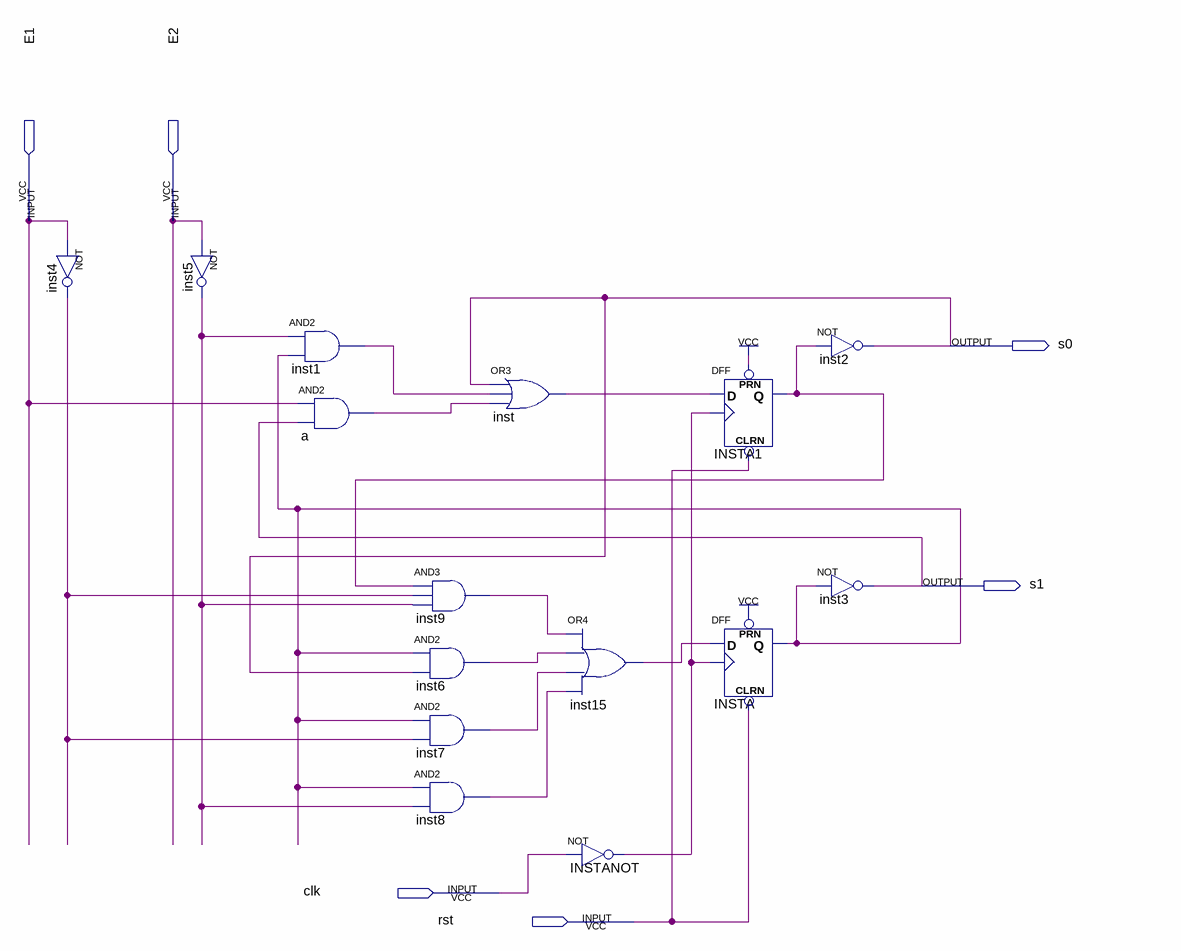
[diagram p0: schematic sheet]
// Quartus schematic P2 (1).bdf as structural Verilog: 15 symbols, 6 pins
module \P2_(1)  (
  input  E1,
  input  E2,
  input  clk,
  input  rst,
  output s0,
  output s1
);

  wire a_out, inst1_out, inst4_out, inst5_out, inst6_out, inst7_out, inst8_out, inst9_out, inst15_out,
       inst_out, INSTA1_q, INSTA_q, INSTANOT_out;

  not inst4 (inst4_out, E1);
  not inst5 (inst5_out, E2);
  and inst1 (inst1_out, inst5_out, INSTA_q);
  and a (a_out, E1, s1);
  and inst9 (inst9_out, INSTA1_q, inst4_out, inst5_out);
  and inst6 (inst6_out, INSTA_q, s0);
  and inst7 (inst7_out, INSTA_q, inst4_out);
  and inst8 (inst8_out, INSTA_q, inst5_out);
  or inst (inst_out, s0, inst1_out, a_out);
  or inst15 (inst15_out, inst9_out, inst6_out, inst7_out, inst8_out);
  not INSTANOT (INSTANOT_out, clk);
  DFF INSTA1 (.CLRN(rst), .CLK(INSTANOT_out), .D(inst_out), .PRN(1'b1), .Q(INSTA1_q));
  DFF INSTA (.CLRN(rst), .CLK(INSTANOT_out), .D(inst15_out), .PRN(1'b1), .Q(INSTA_q));
  not inst2 (s0, INSTA1_q);
  not inst3 (s1, INSTA_q);
endmodule
